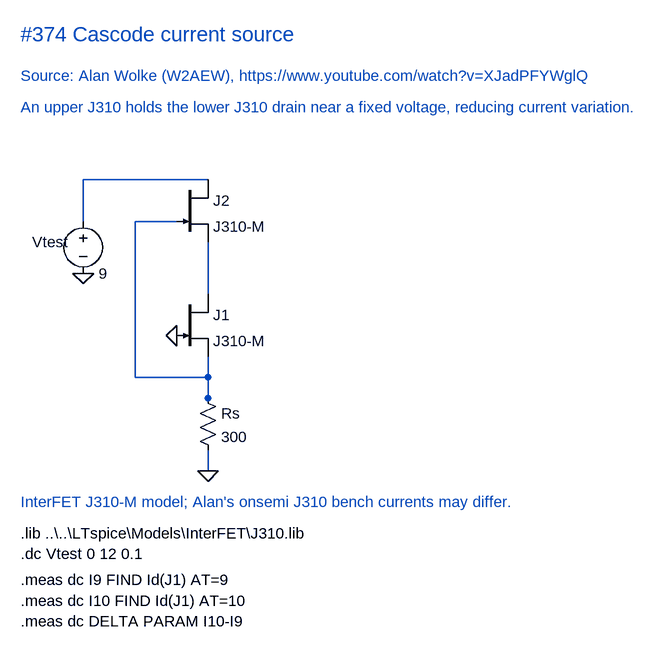
[diagram p0: schematic Cascode current source.asc]
Cascode current source.asc, the LTspice schematic file:
Version 4.1
SHEET 1 960 920
WIRE 128 256 320 256
WIRE 128 256 128 320
WIRE 320 432 320 352
WIRE 320 592 320 528
WIRE 320 704 320 672
WIRE 208 320 272 320
WIRE 208 560 208 320
WIRE 320 560 208 560
WIRE 320 592 320 560
FLAG 128 400 0
FLAG 272 496 0
FLAG 320 704 0
SYMBOL voltage 128 304 R0
WINDOW 0 -24 48 Right 2
SYMATTR InstName Vtest
SYMATTR Value 9
SYMBOL njf 272 256 R0
SYMATTR InstName J2
SYMATTR Value J310-M
SYMBOL njf 272 432 R0
SYMATTR InstName J1
SYMATTR Value J310-M
SYMBOL res 304 576 R0
SYMATTR InstName Rs
SYMATTR Value 300
TEXT 32 32 Left 3 ;#374 Cascode current source
TEXT 32 96 Left 2 ;Source: Alan Wolke (W2AEW), https://www.youtube.com/watch?v=XJadPFYWglQ
TEXT 32 144 Left 2 ;An upper J310 holds the lower J310 drain near a fixed voltage, reducing current variation.
TEXT 32 752 Left 2 ;InterFET J310-M model; Alan's onsemi J310 bench currents may differ.
TEXT 32 800 Left 2 !.lib ..\..\LTspice\Models\InterFET\J310.lib
TEXT 32 832 Left 2 !.dc Vtest 0 12 0.1
TEXT 32 872 Left 2 !.meas dc I9 FIND Id(J1) AT=9
TEXT 32 904 Left 2 !.meas dc I10 FIND Id(J1) AT=10
TEXT 32 936 Left 2 !.meas dc DELTA PARAM I10-I9

The netlist it stands for:
* Cascode current source.asc
Vtest N001 0 9
J2 N001 N003 N002 J310-M
J1 N002 0 N003 J310-M
Rs N003 0 300
.model NJF NJF
.model PJF PJF
.lib standard.jft
* #374 Cascode current source
* Source: Alan Wolke (W2AEW), https://www.youtube.com/watch?v=XJadPFYWglQ
* An upper J310 holds the lower J310 drain near a fixed voltage, reducing current variation.
* InterFET J310-M model; Alan's onsemi J310 bench currents may differ.
.lib ..\..\LTspice\Models\InterFET\J310.lib
.dc Vtest 0 12 0.1
.meas dc I9 FIND Id(J1) AT=9
.meas dc I10 FIND Id(J1) AT=10
.meas dc DELTA PARAM I10-I9
.backanno
.end